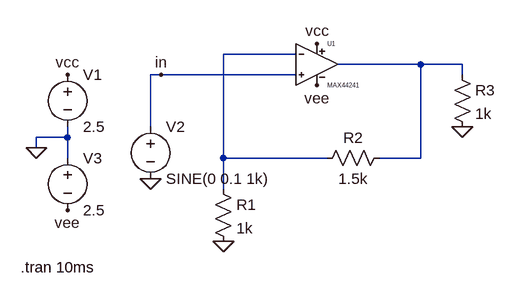
[diagram p0: schematic max44241_opamp.asc]
max44241_opamp.asc, the LTspice schematic file:
Version 4
SHEET 1 880 680
WIRE 176 128 64 128
WIRE 368 144 240 144
WIRE 432 144 368 144
WIRE -32 160 -48 160
WIRE 176 160 -32 160
WIRE 432 160 432 144
WIRE -48 240 -48 160
WIRE -176 256 -176 240
WIRE -176 256 -224 256
WIRE -224 272 -224 256
WIRE -176 288 -176 256
WIRE 64 288 64 128
WIRE 224 288 64 288
WIRE 368 288 368 144
WIRE 368 288 304 288
WIRE 64 336 64 288
FLAG -224 272 0
FLAG -176 160 vcc
FLAG 208 112 vcc
FLAG 208 176 vee
FLAG -176 368 vee
FLAG -48 320 0
FLAG 432 240 0
FLAG 64 416 0
FLAG -32 160 in
SYMBOL MAX44241 208 80 R0
SYMATTR InstName U1
SYMBOL res 48 320 R0
SYMATTR InstName R1
SYMATTR Value 1k
SYMBOL res 320 272 R90
WINDOW 0 0 56 VBottom 2
WINDOW 3 32 56 VTop 2
SYMATTR InstName R2
SYMATTR Value 1.5k
SYMBOL voltage -176 144 R0
WINDOW 123 0 0 Left 2
WINDOW 39 0 0 Left 2
SYMATTR InstName V1
SYMATTR Value 2.5
SYMBOL voltage -48 224 R0
WINDOW 123 0 0 Left 2
WINDOW 39 0 0 Left 2
SYMATTR InstName V2
SYMATTR Value SINE(0 0.1 1k)
SYMBOL voltage -176 272 R0
WINDOW 123 0 0 Left 2
WINDOW 39 0 0 Left 2
SYMATTR InstName V3
SYMATTR Value 2.5
SYMBOL res 416 144 R0
SYMATTR InstName R3
SYMATTR Value 1k
TEXT -248 456 Left 2 !.tran 10ms

The netlist it stands for:
* max44241_opamp.asc
XU1 in N001 vcc vee N002 MAX44241  ; pins INA+ INA- VDD VSS OUTA
R1 N001 0 1k
R2 N002 N001 1.5k
V1 vcc 0 2.5
V2 in 0 SINE(0 0.1 1k)
V3 0 vee 2.5
R3 N002 0 1k
.tran 10ms
.lib MAX44241.lib
.backanno
.end